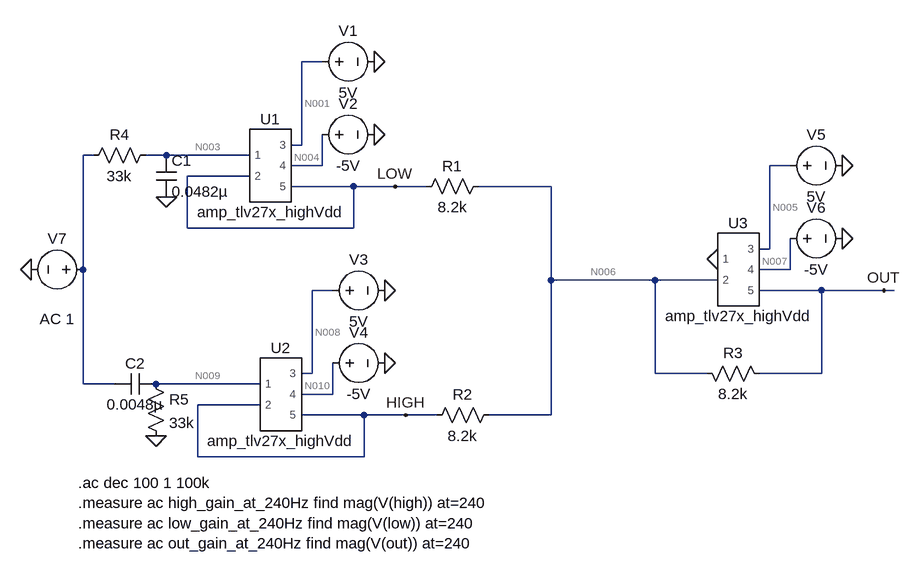
[diagram p0: schematic Exercise-8-6_band-reject-filter.asc]
Exercise-8-6_band-reject-filter.asc, the LTspice schematic file:
Version 4.1
SHEET 1 1160 684
WIRE 192 -64 160 -64
WIRE 160 64 160 -64
WIRE 160 64 144 64
WIRE -160 80 -176 80
WIRE -48 80 -80 80
WIRE 80 80 -48 80
WIRE 192 96 192 48
WIRE 192 96 144 96
WIRE 912 96 880 96
WIRE 80 112 -16 112
WIRE 240 128 144 128
WIRE 304 128 240 128
WIRE 352 128 304 128
WIRE 544 128 432 128
WIRE -16 192 -16 112
WIRE 240 192 240 128
WIRE 240 192 -16 192
WIRE 880 224 880 96
WIRE 880 224 864 224
WIRE -176 256 -176 80
WIRE 912 256 912 208
WIRE 912 256 864 256
WIRE 544 272 544 128
WIRE 704 272 544 272
WIRE 800 272 704 272
WIRE 208 288 176 288
WIRE 960 288 864 288
WIRE 1056 288 960 288
WIRE 1072 288 1056 288
WIRE 176 416 176 288
WIRE 176 416 160 416
WIRE 704 416 704 272
WIRE 784 416 704 416
WIRE 960 416 960 288
WIRE 960 416 864 416
WIRE -176 432 -176 256
WIRE -128 432 -176 432
WIRE 96 432 -64 432
WIRE 208 448 208 400
WIRE 208 448 160 448
WIRE 96 464 0 464
WIRE 256 480 160 480
WIRE 320 480 256 480
WIRE 368 480 320 480
WIRE 544 480 544 272
WIRE 544 480 448 480
WIRE 0 544 0 464
WIRE 256 544 256 480
WIRE 256 544 0 544
FLAG 272 -64 0
FLAG 272 48 0
FLAG 288 288 0
FLAG 288 400 0
FLAG 992 96 0
FLAG 992 208 0
FLAG 800 240 0
FLAG 1056 288 OUT
FLAG -48 144 0
FLAG -64 512 0
FLAG -256 256 0
FLAG 304 128 LOW
FLAG 320 480 HIGH
SYMBOL EEL3111C\\amp_tlv27x_highVdd 112 96 R0
SYMATTR InstName U1
SYMBOL voltage 176 -64 R270
WINDOW 0 32 56 VTop 2
WINDOW 3 -32 56 VBottom 2
WINDOW 123 0 0 Left 0
WINDOW 39 0 0 Left 0
SYMATTR InstName V1
SYMATTR Value 5V
SYMBOL voltage 176 48 R270
WINDOW 0 32 56 VTop 2
WINDOW 3 -32 56 VBottom 2
WINDOW 123 0 0 Left 0
WINDOW 39 0 0 Left 0
SYMATTR InstName V2
SYMATTR Value -5V
SYMBOL res 448 112 R90
WINDOW 0 0 56 VBottom 2
WINDOW 3 32 56 VTop 2
SYMATTR InstName R1
SYMATTR Value 8.2k
SYMBOL EEL3111C\\amp_tlv27x_highVdd 128 448 R0
SYMATTR InstName U2
SYMBOL voltage 192 288 R270
WINDOW 0 32 56 VTop 2
WINDOW 3 -32 56 VBottom 2
WINDOW 123 0 0 Left 0
WINDOW 39 0 0 Left 0
SYMATTR InstName V3
SYMATTR Value 5V
SYMBOL voltage 192 400 R270
WINDOW 0 32 56 VTop 2
WINDOW 3 -32 56 VBottom 2
WINDOW 123 0 0 Left 0
WINDOW 39 0 0 Left 0
SYMATTR InstName V4
SYMATTR Value -5V
SYMBOL res 464 464 R90
WINDOW 0 0 56 VBottom 2
WINDOW 3 32 56 VTop 2
SYMATTR InstName R2
SYMATTR Value 8.2k
SYMBOL EEL3111C\\amp_tlv27x_highVdd 832 256 R0
SYMATTR InstName U3
SYMBOL voltage 896 96 R270
WINDOW 0 32 56 VTop 2
WINDOW 3 -32 56 VBottom 2
WINDOW 123 0 0 Left 0
WINDOW 39 0 0 Left 0
SYMATTR InstName V5
SYMATTR Value 5V
SYMBOL voltage 896 208 R270
WINDOW 0 32 56 VTop 2
WINDOW 3 -32 56 VBottom 2
WINDOW 123 0 0 Left 0
WINDOW 39 0 0 Left 0
SYMATTR InstName V6
SYMATTR Value -5V
SYMBOL res 768 400 M90
WINDOW 0 0 56 VBottom 2
WINDOW 3 32 56 VTop 2
SYMATTR InstName R3
SYMATTR Value 8.2k
SYMBOL res -64 64 R90
WINDOW 0 0 56 VBottom 2
WINDOW 3 32 56 VTop 2
SYMATTR InstName R4
SYMATTR Value 33k
SYMBOL cap -64 80 R0
SYMATTR InstName C1
SYMATTR Value 0.0482µ
SYMBOL cap -64 416 R90
WINDOW 0 0 32 VBottom 2
WINDOW 3 32 32 VTop 2
SYMATTR InstName C2
SYMATTR Value 0.0048µ
SYMBOL res -80 416 R0
SYMATTR InstName R5
SYMATTR Value 33k
SYMBOL voltage -160 256 R90
WINDOW 0 -32 56 VBottom 2
WINDOW 3 32 56 VTop 2
WINDOW 123 60 56 VTop 2
WINDOW 39 0 0 Left 0
SYMATTR InstName V7
SYMATTR Value ""
SYMATTR Value2 AC 1
TEXT -184 584 Left 2 !.ac dec 100 1 100k\n.measure ac high_gain_at_240Hz find mag(V(high)) at=240\n.measure ac low_gain_at_240Hz find mag(V(low)) at=240\n.measure ac out_gain_at_240Hz find mag(V(out)) at=240

The netlist it stands for:
* Exercise-8-6_band-reject-filter.asc
X§U1 N003 LOW N001 N004 LOW amp_tlv27x_highVdd  ; pins 1 2 3 4 5
V1 N001 0 5V
V2 N004 0 -5V
R1 N006 LOW 8.2k
X§U2 N009 HIGH N008 N010 HIGH amp_tlv27x_highVdd  ; pins 1 2 3 4 5
V3 N008 0 5V
V4 N010 0 -5V
R2 N006 HIGH 8.2k
X§U3 0 N006 N005 N007 OUT amp_tlv27x_highVdd  ; pins 1 2 3 4 5
V5 N005 0 5V
V6 N007 0 -5V
R3 N006 OUT 8.2k
R4 N003 N002 33k
C1 N003 0 0.0482µ
C2 N009 N002 0.0048µ
R5 N009 0 33k
V7 N002 0 AC 1
.ac dec 100 1 100k
.measure ac high_gain_at_240Hz find mag(V(high)) at=240
.measure ac low_gain_at_240Hz find mag(V(low)) at=240
.measure ac out_gain_at_240Hz find mag(V(out)) at=240
.lib TLV271.LIB
.backanno
.end

* Results of the author's LTspice run, read from the files saved beside the schematic
* Operating Point, zero values left out:
*   V(high) = -280.2 µV
*   V(low) = -280.2 µV
*   V(n001) = 5 V
*   V(n003) = 227.7 nV
*   V(n004) = -5 V
*   V(n005) = 5 V
*   V(n006) = -280.4 µV
*   V(n007) = -5 V
*   V(n008) = 5 V
*   V(n009) = 227.7 nV
*   V(n010) = -5 V
*   V(out) = -280.9 µV
*   I(R1) = -27.76 pA
*   I(R2) = -27.76 pA
*   I(R3) = 62.42 pA
*   I(R4) = 6.9 pA
*   I(R5) = 6.9 pA
*   I(V1) = -67.78 µA
*   I(V2) = 67.78 µA
*   I(V3) = -67.78 µA
*   I(V4) = 67.78 µA
*   I(V5) = -67.78 µA
*   I(V6) = 67.78 µA
*   I(V7) = 6.9 pA
*   Ix(u1:1) = -6.9 pA
*   Ix(u1:2) = -6.901 pA
*   Ix(u1:3) = 67.78 µA
*   Ix(u1:4) = -67.78 µA
*   Ix(u1:5) = -20.63 pA
*   Ix(u2:1) = -6.9 pA
*   Ix(u2:2) = -6.901 pA
*   Ix(u2:3) = 67.78 µA
*   Ix(u2:4) = -67.78 µA
*   Ix(u2:5) = -20.63 pA
*   Ix(u3:1) = -6.9 pA
*   Ix(u3:2) = -6.901 pA
*   Ix(u3:3) = 67.78 µA
*   Ix(u3:4) = -67.78 µA
*   Ix(u3:5) = 62.65 pA
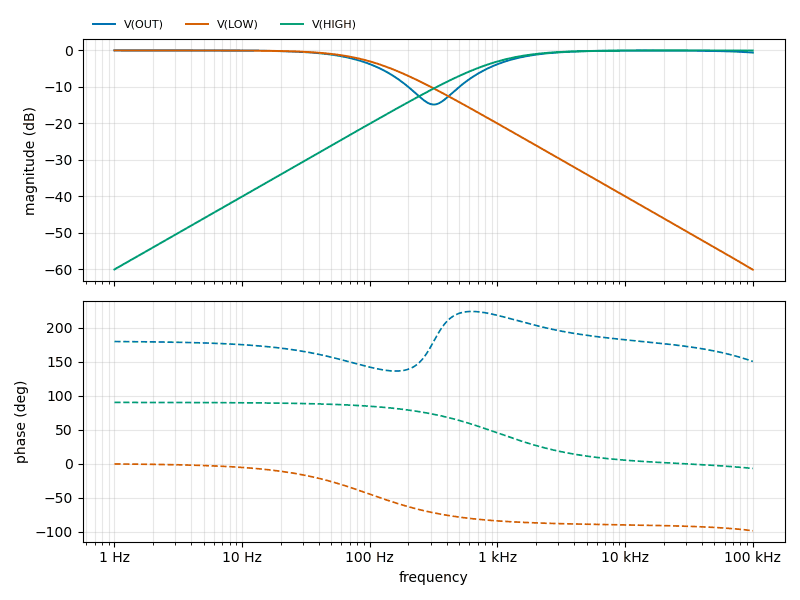
[diagram p1: AC Analysis of Exercise-8-6_band-reject-filter.asc, plotted from the saved traces]
* AC Analysis, 1 run:
*   V(OUT): -0.00 dB at 1 Hz, -0.61 dB at 100 kHz, peak -0.00 dB at 1 Hz, 3 dB below the peak at 87.05 Hz
*   V(LOW): -0.00 dB at 1 Hz, -60.12 dB at 100 kHz, peak -0.00 dB at 1 Hz, 3 dB below the peak at 100.1 Hz
*   V(HIGH): -60.04 dB at 1 Hz, -0.04 dB at 100 kHz, peak -0.01 dB at 32.36 kHz, 3 dB below the peak at 1.003 kHz
* From the log:
*   high_gain_at_240hz: mag(V(high)) =(-12.6808548518dB,0°) at 240
*   low_gain_at_240hz: mag(V(low)) =(-8.29778912813dB,0°) at 240
*   out_gain_at_240hz: mag(V(out)) =(-12.4050060889dB,0°) at 240